# Altium schematic sheet Output-Sheet.SchDoc: =Projectname
size A4; SheetNumber: 4; SheetTotal: 9
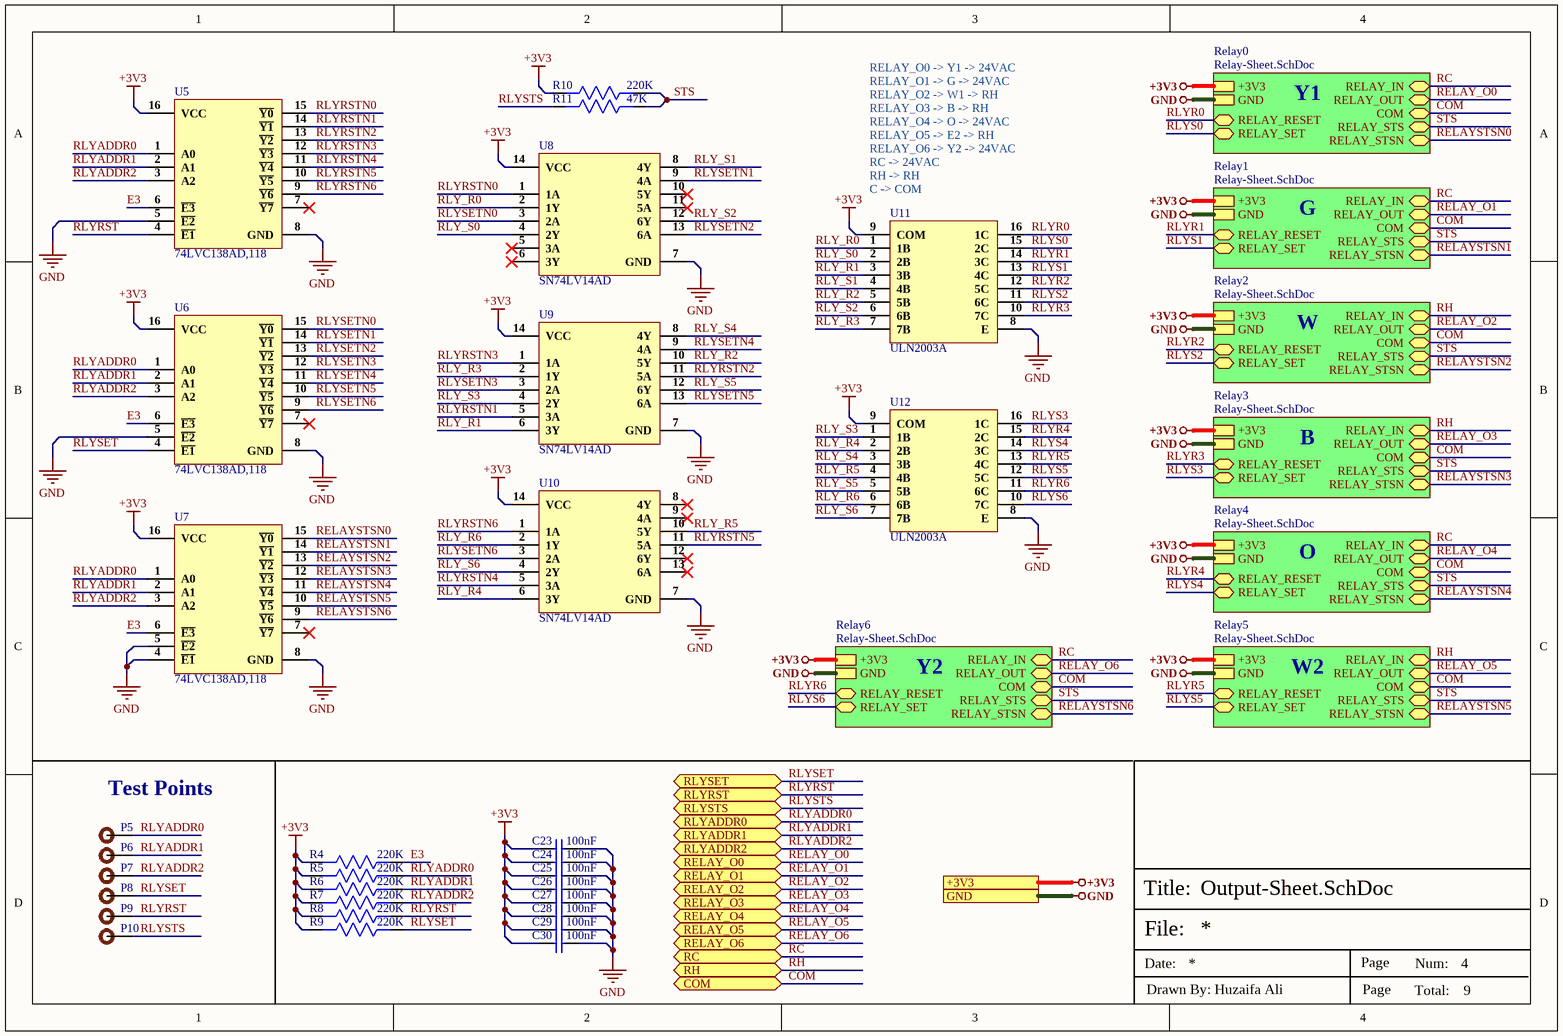
[diagram p0: Output-Sheet.SchDoc]

## Parts
C23  100nF  [Cap-0402]
C24  100nF  [Cap-0402]
C25  100nF  [Cap-0402]
C26  100nF  [Cap-0402]
C27  100nF  [Cap-0402]
C28  100nF  [Cap-0402]
C29  100nF  [Cap-0402]
C30  100nF  [Cap-0402]
P5  TEST POINT  [Test-point]  (value not drawn)
P6  TEST POINT  [Test-point]  (value not drawn)
P7  TEST POINT  [Test-point]  (value not drawn)
P8  TEST POINT  [Test-point]  (value not drawn)
P9  TEST POINT  [Test-point]  (value not drawn)
P10  TEST POINT  [Test-point]  (value not drawn)
R4  220K  [Res-0402]
R5  220K  [Res-0402]
R6  220K  [Res-0402]
R7  220K  [Res-0402]
R8  220K  [Res-0402]
R9  220K  [Res-0402]
R10  220K  [Res-0402]
R11  47K  [Res-0402]
U5  74LVC138AD,118  [16-SOIC]
U6  74LVC138AD,118  [16-SOIC]
U7  74LVC138AD,118  [16-SOIC]
U8  SN74LV14AD  [14-SOIC]
U9  SN74LV14AD  [14-SOIC]
U10  SN74LV14AD  [14-SOIC]
U11  ULN2003A  [SOP-16_150mil]
U12  ULN2003A  [SOP-16_150mil]

## Sub-sheets
Relay0 = Relay-Sheet.SchDoc: +3V3, GND, RELAY_RESET (bidir), RELAY_SET (bidir), RELAY_IN (bidir), RELAY_OUT (bidir), COM (bidir), RELAY_STS (bidir), RELAY_STSN (bidir)
Relay1 = Relay-Sheet.SchDoc: +3V3, GND, RELAY_RESET (bidir), RELAY_SET (bidir), RELAY_IN (bidir), RELAY_OUT (bidir), COM (bidir), RELAY_STS (bidir), RELAY_STSN (bidir)
Relay2 = Relay-Sheet.SchDoc: +3V3, GND, RELAY_RESET (bidir), RELAY_SET (bidir), RELAY_IN (bidir), RELAY_OUT (bidir), COM (bidir), RELAY_STS (bidir), RELAY_STSN (bidir)
Relay3 = Relay-Sheet.SchDoc: +3V3, GND, RELAY_RESET (bidir), RELAY_SET (bidir), RELAY_IN (bidir), RELAY_OUT (bidir), COM (bidir), RELAY_STS (bidir), RELAY_STSN (bidir)
Relay4 = Relay-Sheet.SchDoc: +3V3, GND, RELAY_RESET (bidir), RELAY_SET (bidir), RELAY_IN (bidir), RELAY_OUT (bidir), COM (bidir), RELAY_STS (bidir), RELAY_STSN (bidir)
Relay5 = Relay-Sheet.SchDoc: +3V3, GND, RELAY_RESET (bidir), RELAY_SET (bidir), RELAY_IN (bidir), RELAY_OUT (bidir), COM (bidir), RELAY_STS (bidir), RELAY_STSN (bidir)
Relay6 = Relay-Sheet.SchDoc: +3V3, GND, RELAY_RESET (bidir), RELAY_SET (bidir), RELAY_IN (bidir), RELAY_OUT (bidir), COM (bidir), RELAY_STS (bidir), RELAY_STSN (bidir)

## Ports
+3V3, COM (bidir), GND, RC (bidir), RELAY_O0 (bidir), RELAY_O1 (bidir), RELAY_O2 (bidir), RELAY_O3 (bidir), RELAY_O4 (bidir), RELAY_O5 (bidir), RELAY_O6 (bidir), RH (bidir), RLYADDR0 (bidir), RLYADDR1 (bidir), RLYADDR2 (bidir), RLYRST (bidir), RLYSET (bidir), RLYSTS (bidir)

## Nets
+3V3: C23.1 C24.1 C25.1 C26.1 C27.1 C28.1 C29.1 C30.1 R4.2 R5.2 R6.2 R7.2 R8.2 R9.2 R10.2 U5.16(VCC) U6.16(VCC) U7.16(VCC) U8.14(VCC) U9.14(VCC) U10.14(VCC) U11.9(COM) U12.9(COM) ; port +3V3, sheet Relay0/+3V3, sheet Relay1/+3V3, sheet Relay2/+3V3, sheet Relay3/+3V3, sheet Relay4/+3V3, sheet Relay5/+3V3, sheet Relay6/+3V3
GND: C23.2 C24.2 C25.2 C26.2 C27.2 C28.2 C29.2 C30.2 U5.5(~{E2}) U5.8(GND) U6.5(~{E2}) U6.8(GND) U7.4(~{E1}) U7.5(~{E2}) U7.8(GND) U8.7(GND) U9.7(GND) U10.7(GND) U11.8(E) U12.8(E) ; port GND, sheet Relay0/GND, sheet Relay1/GND, sheet Relay2/GND, sheet Relay3/GND, sheet Relay4/GND, sheet Relay5/GND, sheet Relay6/GND
COM: port COM, sheet Relay0/COM, sheet Relay1/COM, sheet Relay2/COM, sheet Relay3/COM, sheet Relay4/COM, sheet Relay5/COM, sheet Relay6/COM
E3: R4.1 U5.6(~{E3}) U6.6(~{E3}) U7.6(~{E3})
RC: port RC, sheet Relay0/RELAY_IN, sheet Relay1/RELAY_IN, sheet Relay4/RELAY_IN, sheet Relay6/RELAY_IN
RELAY_O0: port RELAY_O0, sheet Relay0/RELAY_OUT
RELAY_O1: port RELAY_O1, sheet Relay1/RELAY_OUT
RELAY_O2: port RELAY_O2, sheet Relay2/RELAY_OUT
RELAY_O3: port RELAY_O3, sheet Relay3/RELAY_OUT
RELAY_O4: port RELAY_O4, sheet Relay4/RELAY_OUT
RELAY_O5: port RELAY_O5, sheet Relay5/RELAY_OUT
RELAY_O6: port RELAY_O6, sheet Relay6/RELAY_OUT
RELAYSTSN0: U7.15(~{Y0}) ; sheet Relay0/RELAY_STSN
RELAYSTSN1: U7.14(~{Y1}) ; sheet Relay1/RELAY_STSN
RELAYSTSN2: U7.13(~{Y2}) ; sheet Relay2/RELAY_STSN
RELAYSTSN3: U7.12(~{Y3}) ; sheet Relay3/RELAY_STSN
RELAYSTSN4: U7.11(~{Y4}) ; sheet Relay4/RELAY_STSN
RELAYSTSN5: U7.10(~{Y5}) ; sheet Relay5/RELAY_STSN
RELAYSTSN6: U7.9(~{Y6}) ; sheet Relay6/RELAY_STSN
RH: port RH, sheet Relay2/RELAY_IN, sheet Relay3/RELAY_IN, sheet Relay5/RELAY_IN
RLY_R0: U8.2(1Y) U11.1(1B)
RLY_R1: U9.6(3Y) U11.3(3B)
RLY_R2: U9.10(5Y) U11.5(5B)
RLY_R3: U9.2(1Y) U11.7(7B)
RLY_R4: U10.6(3Y) U12.2(2B)
RLY_R5: U10.10(5Y) U12.4(4B)
RLY_R6: U10.2(1Y) U12.6(6B)
RLY_S0: U8.4(2Y) U11.2(2B)
RLY_S1: U8.8(4Y) U11.4(4B)
RLY_S2: U8.12(6Y) U11.6(6B)
RLY_S3: U9.4(2Y) U12.1(1B)
RLY_S4: U9.8(4Y) U12.3(3B)
RLY_S5: U9.12(6Y) U12.5(5B)
RLY_S6: U10.4(2Y) U12.7(7B)
RLYADDR0: P5.1 R5.1 U5.1(A0) U6.1(A0) U7.1(A0) ; port RLYADDR0
RLYADDR1: P6.1 R6.1 U5.2(A1) U6.2(A1) U7.2(A1) ; port RLYADDR1
RLYADDR2: P7.1 R7.1 U5.3(A2) U6.3(A2) U7.3(A2) ; port RLYADDR2
RLYR0: U11.16(1C) ; sheet Relay0/RELAY_RESET
RLYR1: U11.14(3C) ; sheet Relay1/RELAY_RESET
RLYR2: U11.12(5C) ; sheet Relay2/RELAY_RESET
RLYR3: U11.10(7C) ; sheet Relay3/RELAY_RESET
RLYR4: U12.15(2C) ; sheet Relay4/RELAY_RESET
RLYR5: U12.13(4C) ; sheet Relay5/RELAY_RESET
RLYR6: U12.11(6C) ; sheet Relay6/RELAY_RESET
RLYRST: P9.1 R8.1 U5.4(~{E1}) ; port RLYRST
RLYRSTN0: U5.15(~{Y0}) U8.1(1A)
RLYRSTN1: U5.14(~{Y1}) U9.5(3A)
RLYRSTN2: U5.13(~{Y2}) U9.11(5A)
RLYRSTN3: U5.12(~{Y3}) U9.1(1A)
RLYRSTN4: U5.11(~{Y4}) U10.5(3A)
RLYRSTN5: U5.10(~{Y5}) U10.11(5A)
RLYRSTN6: U5.9(~{Y6}) U10.1(1A)
RLYS0: U11.15(2C) ; sheet Relay0/RELAY_SET
RLYS1: U11.13(4C) ; sheet Relay1/RELAY_SET
RLYS2: U11.11(6C) ; sheet Relay2/RELAY_SET
RLYS3: U12.16(1C) ; sheet Relay3/RELAY_SET
RLYS4: U12.14(3C) ; sheet Relay4/RELAY_SET
RLYS5: U12.12(5C) ; sheet Relay5/RELAY_SET
RLYS6: U12.10(7C) ; sheet Relay6/RELAY_SET
RLYSET: P8.1 R9.1 U6.4(~{E1}) ; port RLYSET
RLYSETN0: U6.15(~{Y0}) U8.3(2A)
RLYSETN1: U6.14(~{Y1}) U8.9(4A)
RLYSETN2: U6.13(~{Y2}) U8.13(6A)
RLYSETN3: U6.12(~{Y3}) U9.3(2A)
RLYSETN4: U6.11(~{Y4}) U9.9(4A)
RLYSETN5: U6.10(~{Y5}) U9.13(6A)
RLYSETN6: U6.9(~{Y6}) U10.3(2A)
RLYSTS: P10.1 R11.2 ; port RLYSTS
STS: R10.1 R11.1 ; sheet Relay0/RELAY_STS, sheet Relay1/RELAY_STS, sheet Relay2/RELAY_STS, sheet Relay3/RELAY_STS, sheet Relay4/RELAY_STS, sheet Relay5/RELAY_STS, sheet Relay6/RELAY_STS

Not connected (* = marked no-connect by the designer): U5 7(~{Y7})*; U6 7(~{Y7})*; U7 7(~{Y7})*; U8 5(3A)* 6(3Y)* 10(5Y)* 11(5A)*; U10 8(4Y)* 9(4A)* 12(6Y)* 13(6A)*

## Notes on the sheet
- Y1
- (near U11) RELAY_O0 -> Y1 -> 24VAC
  RELAY_O1 -> G -> 24VAC
  RELAY_O2 -> W1 -> RH
  RELAY_O3 -> B -> RH
  RELAY_O4 -> O -> 24VAC
  RELAY_O5 -> E2 -> RH
  RELAY_O6 -> Y2 -> 24VAC
  RC -> 24VAC
  RH -> RH
  C -> COM
- G
- W
- B
- O
- Y2
- W2
- Test Points
- File:
- Title:
- Date:
- Page
- Num:
- Total:
- Drawn By: Huzaifa Ali

## Library data of the parts
C23-C30 = CC0402KRX5R8BB104: CAP CER 0.1UF 25V X5R 0402; Manufacturer: Yageo; Tolerance: 10%; Item Type: Capacitor; Supplier 1: Digi-Key; Manufacturer Part Number: CC0402KRX5R8BB104; RoHS: Yes; Category: Ceramic Capacitors; Stock 1: 4598218; Pricing 1: 1=0.10000, 10=0.03800, 50=0.02100, 100=0.01710, 500=0.01224, 1000=0.00961, 2500=0.00874, 5000=0.00804 (USD); Mount: Surface Mount; Case/Package: 0402; Case Code (Metric): 1005; Case Code (Imperial): 0402; Min Operating Temperature: -55°C; Max Operating Temperature: 85°C; Voltage Rating: 25V; Packaging: Tape and Reel; Capacitance: 100nF; Voltage Rating (DC): 25V; Dielectric: X5R; Resistor Type: Ceramic; Series: CC; Length: 0.039inch; Width: 0.02inch; Thickness: 0.022inch; Depth: 0.5mm; Lead Free: Lead Free; Halogen Free: Halogen Free; RoHS Compliant: Yes; ComponentLink1URL: http://www.mouser.com/ds/2/447/UPY-GPHC_X5R_4V-to-50V_25-1131599.pdf?src-supplier=Mouser; ComponentLink1Description: http://www.mouser.com/ds/2/447/UPY-GPHC_X5R_4V-to-50V_25-1131599.pdf?src-supplier=Mouser; ComponentLink2URL: http://www.yageo.com/documents/recent/UPY-GPHC_X5R_4V-to-50V-16.pdf?src-supplier=Future+Electronics; ComponentLink2Description: http://www.yageo.com/documents/recent/UPY-GPHC_X5R_4V-to-50V-16.pdf?src-supplier=Future+Electronics; ComponentLink3URL: http://www.yageo.com/documents/recent/UPY-GPHC_X5R_4V-to-50V_25.pdf?src-supplier=Digi-Key; ComponentLink3Description: http://www.yageo.com/documents/recent/UPY-GPHC_X5R_4V-to-50V_25.pdf?src-supplier=Digi-Key; Supplier Part Number 1: 311-1697-1-ND; LCSC Part Number: C106256
P5-P10 = TEST POINT: Test Point ON
R4-R10 = RC0402FR-07220KL: RES 220K OHM 1% 1/16W 0402; Manufacturer: Yageo; Resistance: 220kR; Power Rating: 62.5mW; Voltage Rating: 50V; Temperature Coefficient: 100ppm/°C; Max Power Dissipation: 63mW; Supplier 1: Digi-Key; Manufacturer Part Number: RC0402FR-07220KL; RoHS: Yes; Category: Chip SMD Resistors; Stock 1: 1192792; Pricing 1: 1=0.10000, 10=0.01400, 100=0.00580, 1000=0.00262, 2500=0.00228, 5000=0.00188 (USD); Case/Package: 0402; Case Code (Imperial): 0402; Case Code (Metric): 1005; Weight: 2.3E-05oz; Size Code: 0402; Min Operating Temperature: -55°C; Max Operating Temperature: 155°C; Tolerance: 1%; Package Quantity: 1; Packaging: Tape and Reel; Termination: SMD/SMT; Resistor Type: Thick Film; Number of Terminations: 2; Features: Moisture Resistant; Series: RC; Resistance Tolerance: 1%; Technology: THICK FILM; Construction: Rectangular; Length: 1mm; Width: 0.02inch; Height: 0.016inch; Depth: 0.5mm; RoHS Compliant: Yes; Reach SVHC Compliant: Yes; Military Standard: Not; Lead Free: Lead Free; ComponentLink1URL: https://datasheet.ciiva.com/11808/0900766b80c66297-11808792.pdf?src-supplier=RSComponents; ComponentLink1Description: https://datasheet.ciiva.com/11808/0900766b80c66297-11808792.pdf?src-supplier=RSComponents; ComponentLink2URL: https://datasheet.ciiva.com/5924/1018594-5924944.pdf?src-supplier=Farnell; ComponentLink2Description: https://datasheet.ciiva.com/5924/1018594-5924944.pdf?src-supplier=Farnell; ComponentLink3URL: https://datasheet.ciiva.com/2453/pyu-r-int-thick-7-2453533.pdf?src-supplier=Digi-Key; ComponentLink3Description: https://datasheet.ciiva.com/2453/pyu-r-int-thick-7-2453533.pdf?src-supplier=Digi-Key; ComponentLink4URL: https://datasheet.ciiva.com/2453/pyu-r-int-thick-7-2453534.pdf?src-supplier=Digi-Key; ComponentLink4Description: https://datasheet.ciiva.com/2453/pyu-r-int-thick-7-2453534.pdf?src-supplier=Digi-Key; ComponentLink5URL: https://datasheet.ciiva.com/2453/pyu-r-int-thick-7-2453532.pdf?src-supplier=Digi-Key; ComponentLink5Description: https://datasheet.ciiva.com/2453/pyu-r-int-thick-7-2453532.pdf?src-supplier=Digi-Key; ComponentLink6URL: https://datasheet.ciiva.com/12577/pyu-rc0402-51-rohs-l-6-r-12577270.pdf?src-supplier=Mouser; ComponentLink6Description: https://datasheet.ciiva.com/12577/pyu-rc0402-51-rohs-l-6-r-12577270.pdf?src-supplier=Mouser; Supplier Part Number 1: 311-220KLRCT-ND
R11 = RC0402FR-0747KL: RES 47K OHM 1% 1/16W 0402; Manufacturer: Yageo; Power Rating: 62.5mW; Temperature Coefficient: 100ppm/°C; Voltage Rating: 50V; Resistance: 47kR; Max Power Dissipation: 63mW; Item Type: Resistor; Supplier 1: Avnet; Manufacturer Part Number: RC0402FR-0747KL; RoHS: Yes; Category: Chip SMD Resistors; Stock 1: 680000; Pricing 1: 10000=0.00085, 20000=0.00087, 40000=0.00084, 60000=0.00083, 80000=0.00079, 100000=0.00078, 1000000=0.00076 (USD); Case/Package: 0402; Case Code (Imperial): 0402; Case Code (Metric): 1005; Size Code: 0402; Min Operating Temperature: -55°C; Max Operating Temperature: 155°C; Tolerance: 1%; Series: RC; Packaging: Tape and Reel; Package Quantity: 1; Termination: SMD/SMT; Resistor Type: Thick Film; Number of Terminations: 2; Features: Moisture Resistant; Resistance Tolerance: 1%; Construction: Rectangular; Length: 1mm; Width: 0.02inch; Height: 0.016inch; Depth: 0.5mm; RoHS Compliant: Yes; Military Standard: Not; Lead Free: Lead Free; ComponentLink1URL: https://datasheet.ciiva.com/46412/1018594-46412839.pdf?src-supplier=Element14; ComponentLink1Description: https://datasheet.ciiva.com/46412/1018594-46412839.pdf?src-supplier=Element14; ComponentLink2URL: https://datasheet.ciiva.com/2453/pyu-r-int-thick-7-2453389.pdf?src-supplier=Digi-Key; ComponentLink2Description: https://datasheet.ciiva.com/2453/pyu-r-int-thick-7-2453389.pdf?src-supplier=Digi-Key; ComponentLink3URL: https://datasheet.ciiva.com/2453/pyu-r-int-thick-7-2453390.pdf?src-supplier=Digi-Key; ComponentLink3Description: https://datasheet.ciiva.com/2453/pyu-r-int-thick-7-2453390.pdf?src-supplier=Digi-Key; ComponentLink4URL: https://datasheet.ciiva.com/2453/pyu-r-int-thick-7-2453388.pdf?src-supplier=Digi-Key; ComponentLink4Description: https://datasheet.ciiva.com/2453/pyu-r-int-thick-7-2453388.pdf?src-supplier=Digi-Key; ComponentLink5URL: https://datasheet.ciiva.com/15189/getdatasheetpartid-323748-15189466.pdf?src-supplier=Verical; ComponentLink5Description: https://datasheet.ciiva.com/15189/getdatasheetpartid-323748-15189466.pdf?src-supplier=Verical; ComponentLink6URL: https://datasheet.ciiva.com/16793/pyu-rc0402-51-rohs-l-6-r-16793430.pdf?src-supplier=Future+Electronics; ComponentLink6Description: https://datasheet.ciiva.com/16793/pyu-rc0402-51-rohs-l-6-r-16793430.pdf?src-supplier=Future+Electronics; Supplier Part Number 1: RC0402FR-0747KL; LCSC Part Number: C93943
U5-U7 = 74LVC138AD,118: IC DECODER/DEMUX 3-8 INV 16SOIC; Manufacturer: Nexperia; Supplier 1: Avnet; Manufacturer Part Number: 74LVC138AD,118; RoHS: Yes; Category: Decoders and Multiplexers; Stock 1: 17684; Pricing 1: 2995=0.11690, 3000=0.11440, 6000=0.11189, 15000=0.10939, 30000=0.10688, 150000=0.10438, 300000=0.10187 (USD); RoHS Compliant: Yes; Supplier Part Number 1: 74LVC138AD,118; LCSC Part Number: C6061; Item Type: IC; ComponentLink1Description: LCSC; ComponentLink1URL: https://www.lcsc.com/product-detail/Signal-Switches-Encoders-Decoders-Multiplexers_Nexperia-74LVC138AD-118_C6061.html
U8-U10 = SN74LV14AD: SOIC-14 Inverters ROHS; Manufacturer: Texas Instruments; Logic Function: Buffer,Inverter,Schmitt Trigger; Number of Elements: 6; Output Current: 12mA; Number of Inputs: 1; Min Supply Voltage: 2V; Max Supply Voltage: 5.5V; Propagation Delay: 27ns; Quiescent Current: 20uA; High Level Output Current: -12mA; Turn-On Delay Time: 12ns; Input Type: SCHMITT TRIGGER; Schmitt Trigger Input: Yes; Item Type: IC; Supplier 1: Digi-Key; Manufacturer Part Number: SN74LV14AD; RoHS: Yes; Category: Logic Gates; Stock 1: 2467; Pricing 1: 1=1.16000, 10=1.04100, 25=0.98840, 100=0.81190, 250=0.75892, 500=0.67066, 1000=0.52947, 2500=0.49950 (USD); Mount: Surface Mount; Case/Package: SOIC; Number of Pins: 14; Weight: 0.004318oz; Min Operating Temperature: -40°C; Max Operating Temperature: 125°C; Package Quantity: 50; Packaging: Rail/Tube; Number of Circuits: 6; Low Level Output Current: 12mA; Series: 74LV; Technology: CMOS; Number of Bits: 6; Number of Gates: 6; Length: 8.65mm; Width: 3.91mm; Height: 1.58mm; Radiation Hardening: No; Lead Free: Lead Free; RoHS Compliant: Yes; Reach SVHC Compliant: Yes; ComponentLink1URL: https://datasheet.ciiva.com/27050/917231-27050962.pdf?src-supplier=Jameco; ComponentLink1Description: https://datasheet.ciiva.com/27050/917231-27050962.pdf?src-supplier=Jameco; ComponentLink2URL: https://datasheet.ciiva.com/7948/1633820-7948979.pdf?src-supplier=Element14; ComponentLink2Description: https://datasheet.ciiva.com/7948/1633820-7948979.pdf?src-supplier=Element14; ComponentLink3URL: https://datasheet.ciiva.com/15089/getdatasheetpartid-253475-15089486.pdf?src-supplier=Verical; ComponentLink3Description: https://datasheet.ciiva.com/15089/getdatasheetpartid-253475-15089486.pdf?src-supplier=Verical; ComponentLink4URL: https://datasheet.ciiva.com/1866/sn74lv14a-1866324.pdf?src-supplier=Digi-Key; ComponentLink4Description: https://datasheet.ciiva.com/1866/sn74lv14a-1866324.pdf?src-supplier=Digi-Key; ComponentLink5URL: https://datasheet.ciiva.com/14290/sn74lv14a-14290269.pdf?src-supplier=Avnet; ComponentLink5Description: https://datasheet.ciiva.com/14290/sn74lv14a-14290269.pdf?src-supplier=Avnet; Supplier Part Number 1: 296-1678-5-ND; LCSC Part Number: C2860778
U11 U12 = ULN2003A: 100uA@50V 3V@2V,300mA 1.6V@350mA 4mA@12V 100uA@50V 1.25V@350mA 500mA 25pF SOP-16_150mil Darlington Transistor Arrays ROHS; Manufacturer: Mixic; Item Type: IC; Manufacturer Part Number: ULN2003A; Package: SOP-16_150mil; LCSC Part Number: C181730; ComponentLink1Description: LCSC; ComponentLink1URL: https://www.lcsc.com/product-detail/Darlington-Transistor-Arrays_Mixic-ULN2003A_C181730.html